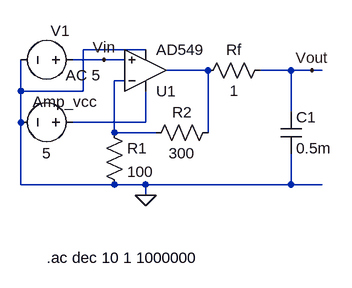
[diagram p0: schematic Simulation.asc]
Simulation.asc, the LTspice schematic file:
Version 4
SHEET 1 880 680
WIRE 432 240 336 240
WIRE 368 256 320 256
WIRE 400 256 368 256
WIRE 528 272 464 272
WIRE 656 272 608 272
WIRE 688 272 656 272
WIRE 704 272 688 272
WIRE 400 288 384 288
WIRE 240 304 240 256
WIRE 336 304 336 240
WIRE 336 304 240 304
WIRE 656 336 656 272
WIRE 240 352 240 304
WIRE 432 352 432 304
WIRE 432 352 320 352
WIRE 384 368 384 288
WIRE 448 368 384 368
WIRE 528 368 528 272
WIRE 240 448 240 352
WIRE 384 448 240 448
WIRE 432 448 384 448
WIRE 656 448 656 400
WIRE 656 448 432 448
WIRE 704 448 656 448
WIRE 432 464 432 448
FLAG 688 272 Vout
FLAG 432 464 0
FLAG 368 256 Vin
SYMBOL AD549 432 336 M180
SYMATTR InstName U1
SYMBOL res 368 352 R0
SYMATTR InstName R1
SYMATTR Value 100
SYMBOL res 544 352 R90
WINDOW 0 0 56 VBottom 2
WINDOW 3 32 56 VTop 2
SYMATTR InstName R2
SYMATTR Value 300
SYMBOL res 624 256 R90
WINDOW 0 0 56 VBottom 2
WINDOW 3 32 56 VTop 2
SYMATTR InstName Rf
SYMATTR Value 1
SYMBOL cap 640 336 R0
SYMATTR InstName C1
SYMATTR Value 0.5m
SYMBOL voltage 336 352 R90
WINDOW 0 -16 28 VBottom 2
WINDOW 3 32 56 VTop 2
SYMATTR InstName Amp_vcc
SYMATTR Value 5
SYMBOL voltage 336 256 R90
WINDOW 0 -29 35 VBottom 2
WINDOW 3 8 0 VTop 2
SYMATTR InstName V1
SYMATTR Value AC 5
SYMATTR Value2 AC 5
TEXT 280 560 Left 2 !.ac dec 10 1 1000000

The netlist it stands for:
* Simulation.asc
XU1 Vin N002 N003 0 N001 AD549  ; pins In+ In- V+ V- OUT
R1 N002 0 100
R2 N001 N002 300
Rf Vout N001 1
C1 Vout 0 0.5m
V§Amp_vcc N003 0 5
V1 Vin 0 AC 5 AC 5
.ac dec 10 1 1000000
.backanno
.end